# Altium schematic sheet UART-USB.SchDoc
size A4; SheetNumber: 2; SheetTotal: 3
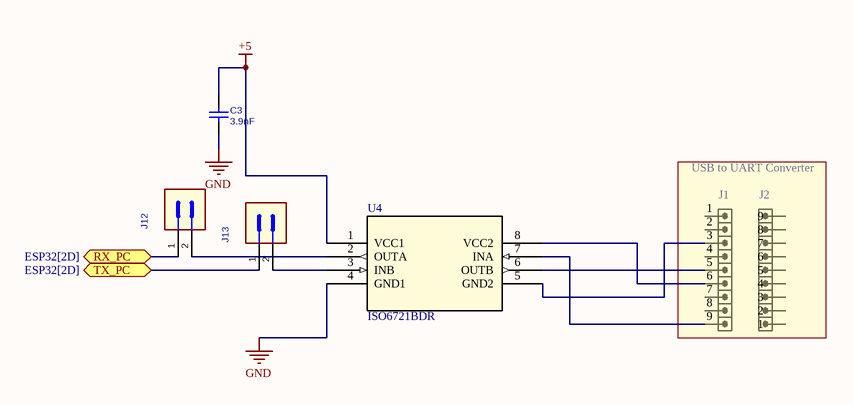
[diagram p0: UART-USB.SchDoc]

## Parts
C3  3.9nF  [CAP0805H1520]
J1  HDR_M_1X9  [HDR_M_1X9]  (value not drawn)
J2  HDR_M_1X9  [HDR_M_1X9]  (value not drawn)
J12  5-825433-0_2/50  [PIN_HEADER_2_54mm_1_1mm_1x2]  (value not drawn)
J13  5-825433-0_2/50  [PIN_HEADER_2_54mm_1_1mm_1x2]  (value not drawn)
U4  ISO6721BDR  [SOIC_1BDR_TEX]

## Blocks framed on the sheet
USB to UART Converter: J1 J2

## Ports
RX_PC (bidir, see ESP32[2D]), TX_PC (bidir, see ESP32[2D])

## Nets
+5: C3.2 U4.1(VCC1)
GND: C3.1 U4.4(GND1)
RX_PC: J12.1 ; port RX_PC
TX_PC: J13.1 ; port TX_PC
NetJ1_3: J1.3 U4.5(GND2)
NetJ1_5: J1.5 U4.6(OUTB)
NetJ1_6: J1.6 U4.8(VCC2)
NetJ1_9: J1.9 U4.7(INA)
NetJ12_2: J12.2 U4.2(OUTA)
NetJ13_2: J13.2 U4.3(INB)

Not connected (* = marked no-connect by the designer): J1 1 2 4 7 8; J2 1 2 3 4 5 6 7 8 9

## Library data of the parts
C3 = UID-1DC189D77836E3ADB330: CAP 3.9nF 5% C0G 50V; SAP-Partnumber: 35031280; Manufacturer Part Number: 08055A392JAT2A; Manufacturer: KYOCERA AVX; Compliance: RoHS2; Temperature - Rated: -55 °C to +125 °C; Reviewer: hoersede; Library Status: Production; uid: UID-1DC189D77836E3ADB330; partid: 60; Category: Ceramic; ComponentLink1Description: Datasheet; ComponentLink1URL: https://code.bbraun.io/BA-RD-EE/altium-partlib/raw/main/components/datasheets/35031280_SMD_KOND-KER_3,9NF_5Proz_50V_C0G_0805/AVX_datasheet_C0GNP0-Dielectric.pdf; ComponentLink2Description: Compliance Certificate; ComponentLink2URL: https://code.bbraun.io/BA-RD-EE/altium-partlib/raw/main/components/datasheets/35031280_SMD_KOND-KER_3,9NF_5Proz_50V_C0G_0805/AVX_datasheet_C0GNP0-Dielectric.pdf; ComponentLink3Description: Datasheet Folder; ComponentLink3URL: https://code.bbraun.io/BA-RD-EE/altium-partlib/raw/main/components/datasheets/35031280_SMD_KOND-KER_3,9NF_5Proz_50V_C0G_0805/; ComponentLink4Description: Data Sheet Library; ComponentLink4URL: http://ais.development.bbraun.com/dsl/35031280; Supplier 1: Mouser; Supplier 2: Digikey; Supplier 3: RS Components; Supplier 4: Farnell; Value: 3.9nF; Tolerance: 5%; Maximum Height: 1.52 mm; Package / Case: 0805; Technology: SMT; Type: C0G; Price@1k: 0,01183 €; Voltage - Rated: 50V; Creator: weirmade; Creation Date: 22.05.2023; Last Updated: 22.05.2023; Review Date: 07.06.2025; Lifecycle Status: Active
J1 J2 = CMP-002-00798-1: VALUE: HDRM9; Component Type: Standard; Pins: 9; Design Item ID: HDR_M_1X9; Source: Conn Header.SchLib
J12 J13 = UID-C948C1FBE4D127CA7C47: THT Pin Header, 1x2, 2.54mm, stehend; SAP-Partnumber: 33193339; Manufacturer: TE Connectivity; Compliance: RoHS2; Contacts: 2; Current Rated: 5A; Voltage - Rated: 750Vrms; Temperature - Rated: -65 °C to + 105 °C; Reviewer: vaupmide; Library Status: Prototype; uid: UID-C948C1FBE4D127CA7C47; partid: 27; Category: Pin Header; Manufacturer Part Number: 5-825433-0; ComponentLink1Description: Datasheet; ComponentLink1URL: https://code.bbraun.io/BA-RD-EE/altium-partlib/raw/main/components/datasheets/33193339_PIN_HEADER_2_54mm_1x50_TE/product-5-825433-0.datasheet.pdf; ComponentLink2Description: Compliance Certificate; ComponentLink2URL: https://code.bbraun.io/BA-RD-EE/altium-partlib/raw/main/components/datasheets/33193339_PIN_HEADER_2_54mm_1x50_TE/product-5-825433-0.datasheet.pdf; ComponentLink3Description: Datasheet Folder; ComponentLink3URL: https://code.bbraun.io/BA-RD-EE/altium-partlib/raw/main/components/datasheets/33193339_PIN_HEADER_2_54mm_1x50_TE; ComponentLink4Description: Data Sheet Library; ComponentLink4URL: http://ais.development.bbraun.com/dsl/33193339; Supplier 1: Mouser; Supplier 2: Digikey; Supplier 3: RS Components; Supplier 4: Farnell; Maximum Height: 8.54 mm; Price@1k: 1,65 €; Creator: sifngu01; Creation Date: 09.02.2023; Last Updated: 22.06.2023; Review Date: 12.06.2024; Lifecycle Status: Active
U4 = CMP-7264-000000-1: General-purpose, dual-channel, 1/1 digital isolator 8-SOIC -40 to 125; Manufacturer_Name: Texas Instruments; Copyright: Copyright (C) 2025 Ultra Librarian. All rights reserved.; Design Item ID: ISO6721BDR; Type: Type; Component Type: Standard; RefDes: RefDes; Source: ISO6721BDR.SchLib; Manufacturer_Part_Number: ISO6721BDR; Pin Count: 8